# EAGLE design source_eagle (EAGLE 6.2)
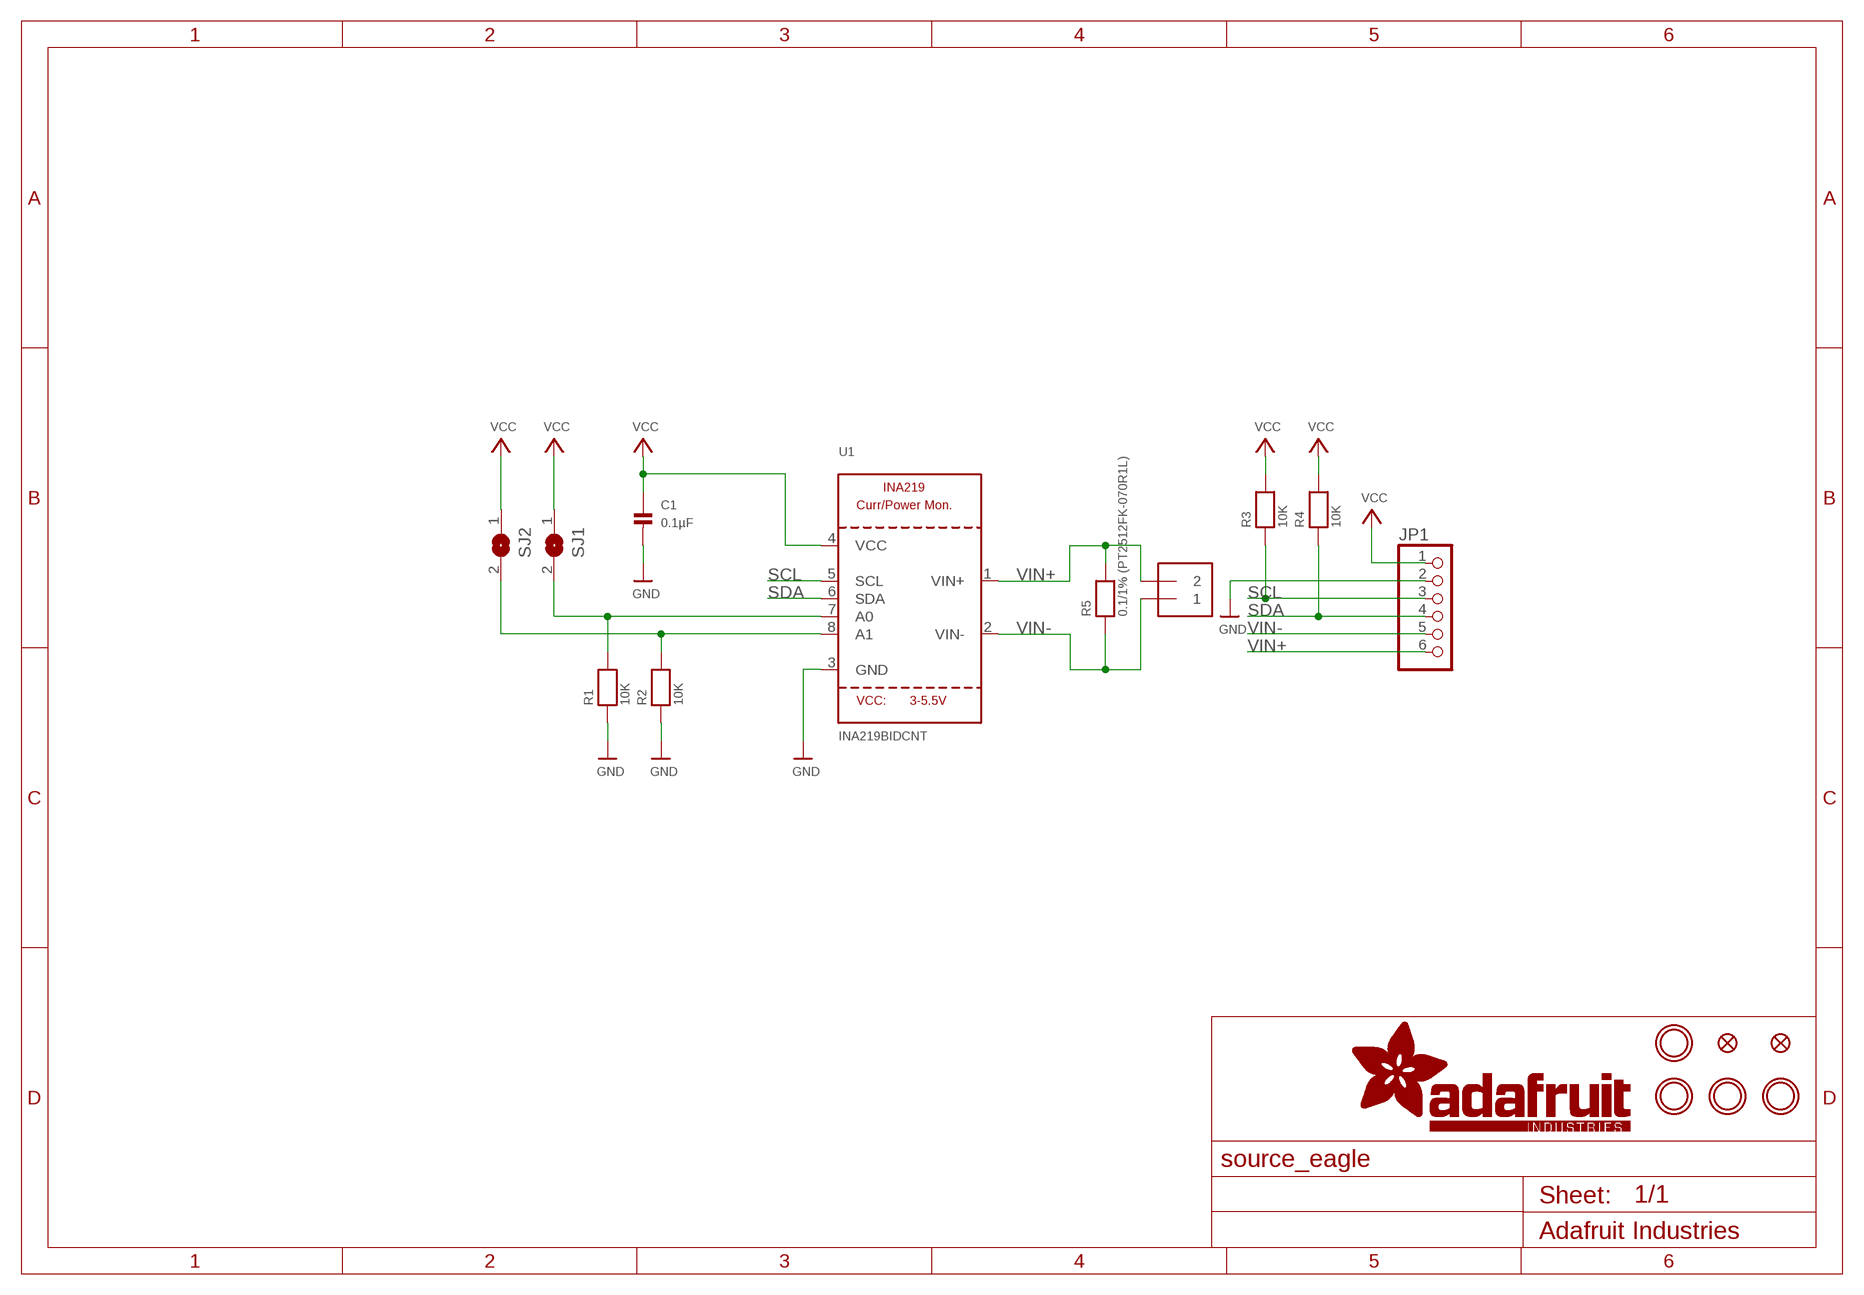
[diagram p0: schematic, sheet 1]

## Parts
C1  0.1µF  CAP_CERAMIC0805  [0805]
FID1  FIDUCIAL""  [FIDUCIAL_1MM]
FID2  FIDUCIAL""  [FIDUCIAL_1MM]
J1  TERMBLOCK_1X2-3.5MM  [1X2-3.5MM]
JP1  HEADER-1X670MIL  [1X06_ROUND_70]
R1  10K  RESISTOR0805  [0805]
R2  10K  RESISTOR0805  [0805]
R3  10K  RESISTOR0805  [0805]
R4  10K  RESISTOR0805  [0805]
R5  0.1/1% (PT2512FK-070R1L)  RESISTOR2512  [2512]
SJ1  SOLDERJUMPERREFLOW_NOPASTE  [SOLDERJUMPER_REFLOW_NOPASTE]
SJ2  SOLDERJUMPERREFLOW_NOPASTE  [SOLDERJUMPER_REFLOW_NOPASTE]
U1  INA219BIDCNT  INA219  [SOT23-8]
U$7  MOUNTINGHOLE2.5  [MOUNTINGHOLE_2.5_PLATED]
U$8  MOUNTINGHOLE2.5  [MOUNTINGHOLE_2.5_PLATED]
U$9  MOUNTINGHOLE2.5  [MOUNTINGHOLE_2.5_PLATED]
U$10  MOUNTINGHOLE2.5  [MOUNTINGHOLE_2.5_PLATED]

## Nets
GND: C1.2 JP1.2 R1.1 R2.1 U1.3(GND)
N$1: R2.2 SJ2.2 U1.8(A1)
N$2: R1.2 SJ1.2 U1.7(A0)
SCL: JP1.3 R3.1 U1.5(SCL)
SDA: JP1.4 R4.1 U1.6(SDA)
VCC: C1.1 JP1.1 R3.2 R4.2 SJ1.1 SJ2.1 U1.4(VCC)
VIN+: J1.2 JP1.6 R5.2 U1.1(VIN+)
VIN-: J1.1 JP1.5 R5.1 U1.2(VIN-)

## Library data of the parts
C1 = microbuilder:CAP_CERAMIC: Ceramic Capacitors 0402 - 0402 Surface Mount Capacitors 16pF 50V 5% [Digikey: 445-4899-2-ND] 18pF 50V 5% [Digikey: 490-1281-2-ND] 22pF 50V 5% [Digikey: 490-1283-2-ND] 68pF 50V 5% [Digikey: 490-1289-2-ND] 0.1uF 10V 10% [Digikey: 490-1318-2-ND] 1.0uF 6.3V 10% [Digikey: 490-1320-2-ND] 0603 - 0603 Surface Mount Capacitors 16 pF 50V 5% [Digikey: 445-5051-2-ND] 22 pF 50V [Digikey: PCC220ACVTR-ND] 33 pF 50V 5% [Digikey: 490-1415-1-ND] 56pF 50V 5% [Digikey: 490-1421-1-ND] 220pF 50V 5% [Digikey: 445-1285-1-ND] 680 pF 50V 2200 pF 50V 5% C0G [Digikey: 445-1297-1-ND] 5600 pF 100V 5% X7R [Digikey: 478-3711-1-ND] 0.1 µF 25V 10% [Digikey: PCC2277TR-ND] 0.22 µF 16V 10% X7R [Digikey: 445-1318-1-ND] 1.0 µF 25V 10% [Digikey: 445-5146-2-ND] 0603 - RF Specific 3pF 250V +/-0.1pF RF [Digikey: 712-1347-1-ND] 18 pF 250V 5% [Digikey: 478-3505-1-ND or 712-1322-1-ND] 56 pF 250V 5% C0G RF [Digikey: 490-4867-1-ND] 68 pF 250V RF [Digikey: 490-4868-1-ND] 0805 - 0805 Surface Mount Capacitors 220 pF 250V 2% RF Ceramic Capacitor [Digikey: 712-1398-1-ND] 1000 pF 50V 2% NP0 Ceramic Capacitor [Digikey: 478-3760-1-ND] 0.1 µF 25V 10% Ceramic Capacitor [Digikey: PCC1828TR-ND] 1.0 µF 16V 10% Ceramic Capacitor[Digikey: 490-1691-2-ND] 10.0 µF 10V 10% Ceramic Capacitor[Digikey: 709-1228-1-ND] 10.0 uF 16V 10% Ceramic Capacitor [Digikey: 478-5165-2-ND] 47 uF 6.3V 20% Ceramic Capacitor [Digikey: 587-1779-1-ND or 399-5506-1-ND] 1206 - 1206 Surface Mount Capacitors 47uF 10V 20% Ceramic Capacitor [Digikey: 490-5528-1-ND or 399-5508-1-ND or 445-6010-1-ND] 100uF 6.3V -20%, +80% Y5V Ceramic Capacitor (Digikey: 490-4512-1-ND, Mouser: 81-GRM31CF50J107ZE1L)
FID1 FID2 = microbuilder:FIDUCIAL: Fiducial Alignment Points Various fiducial points for machine vision alignment.
J1 = microbuilder:TERMBLOCK_1X2: 3.5mm Terminal block http://www.ladyada.net/library/pcb/eaglelibrary.html
JP1 = microbuilder:HEADER-1X6: PIN HEADER
R1-R5 = microbuilder:RESISTOR: Resistors 0402 - 0402 Surface Mount Package 22 Ohm 1% 1/16W [Digikey: 311-22.0LRTR-ND] 33 Ohm 5% 1/16W 1.0K 5% 1/16W 1.5K 5% 1/16W 2.0K 1% 1/16W 10.0K 1% 1/16W [Digikey: 311-10.0KLRTR-ND] 10.0K 5% 1/16W [Digikey: RMCF0402JT10K0TR-ND] 12.1K 1% 1/16W [Digikey: 311-22.0LRTR-ND] 100.0K 5% 1/16W 0603 - 0603 Surface Mount Package 0 Ohm 1/10 Watt 1% Resistor 15 Ohm 1/10 Watt 1% Resistor 33 Ohm 1/10 Watt 1% Resistor 49.9 Ohm 1/10 Watt 1% Resistor 100 Ohm 1/10 Watt 1% Resistor 150 Ohm 1/10 Watt 1% Resistor 240 Ohm 1/10 Watt 1% Resistor 390 Ohm 1/10 Watt 1% Resistor 560 Ohm 1/10 Watt 1% Resistor 680 Ohm 1/10 Watt 1% Resistor 750 Ohm 1/10 Watt 1% Resistor 1.0K Ohm 1/10 Watt 1% Resistor 1.5K Ohm 1/10 Watt 1% Resistor 2.0K Ohm 1/10 Watt 1% Resistor 2.2K Ohm 1/10 Watt 1% Resistor 3.3K Ohm 1/10 Watt 1% Resistor 4.7K Ohm 1/10 Watt 1% Resistor 10.0K Ohm 1/10 Watt 1% Resistor 12.0K Ohm 1/10 Watt 1% Resistor 12.1K Ohm 1/10 Watt 1% Resistor 20.0K Ohm 1/10 Watt 1% Resistor 33.0K Ohm 1/10 Watt 1% Resistor 100.0K Ohm 1/10 Watt 1% Resistor 0805 - 0805 Surface Mount Package 0 Ohm 1/8 Watt 1% Resistor 33 Ohm 1/8 Watt 1% Resistor 100 Ohm 1/8 Watt 1% Resistor 150 Ohm 1/8 Watt 1% Resistor 200 Ohm 1/8 Watt 1% Resistor 240 Ohm 1/8 Watt 1% Resistor 330 Ohm 1/8 Watt 1% Resistor 390 Ohm 1/8 Watt 1% Resistor 470 Ohm 1/8 Watt 1% Resistor 1.0K Ohm 1/8 Watt 1% Resistor 1.5K Ohm 1/8 Watt 1% Resistor 2.0K Ohm 1/8 Watt 1% Resistor 4.7K Ohm 1/8 Watt 1% Resistor 5.1K Ohm 1/8 Watt 1% Resistor 5.6K Ohm 1/8 Watt 1% Resistor 10.0K Ohm 1/8 Watt 1% Resistor 22.0K Ohm 1/8 Watt 1% Resistor 33.0K Ohm 1/8 Watt 1% Resistor 100K Ohm 1/8 Watt 1% Resistor 1206 - 1206 Surface Mount Package 2012 - 2010 Surface Mount Package 0.11 Ohm 1/2 Watt 1% Resistor - Digikey: RHM.11UCT-ND
SJ1 SJ2 = microbuilder:SOLDERJUMPER: SMD Solder JUMPER Solder the two pads together to create a connection, or remove the solder to break it. REFLOW - Use this footprint for solder paste and reflow ovens. WAVE - Use this footprint for hand-soldering (larger pads). CLOSED - Has a trace between the two pads to ensure it is closed by default. The trace needs to be cut to disable the jumper, and can be closed again by creating a solder bridge between the two pads.
U1 = microbuilder:INA219: INA219 - I2C Current/Power Monitor Voltage Range: 0-26V Accuracy: 0.5% Temperature: -40°C - 125°C
U$7-U$10 = microbuilder:MOUNTINGHOLE: Mounting Hole For #2 screws (0.086"/2.18mm width, 0.094"/2.4mm hole) use 2.5mm

## Board
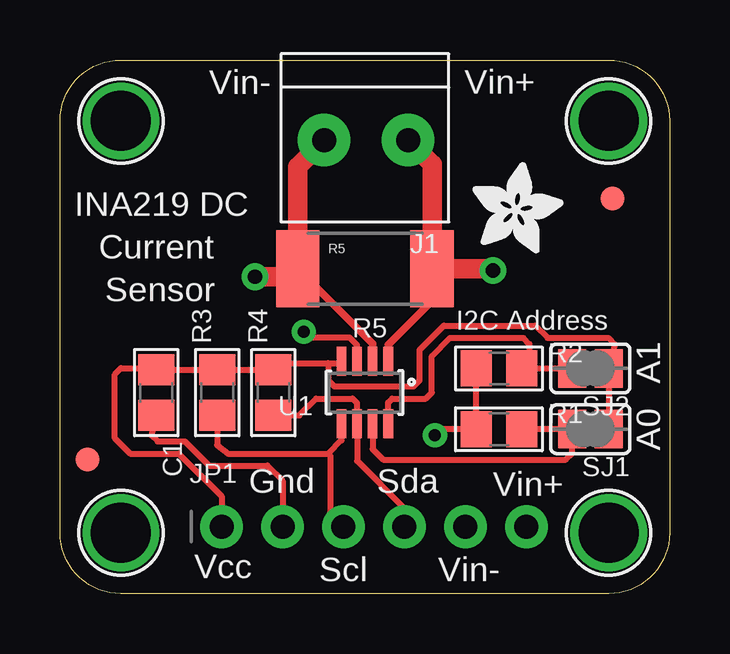
[diagram p1: board, top side]
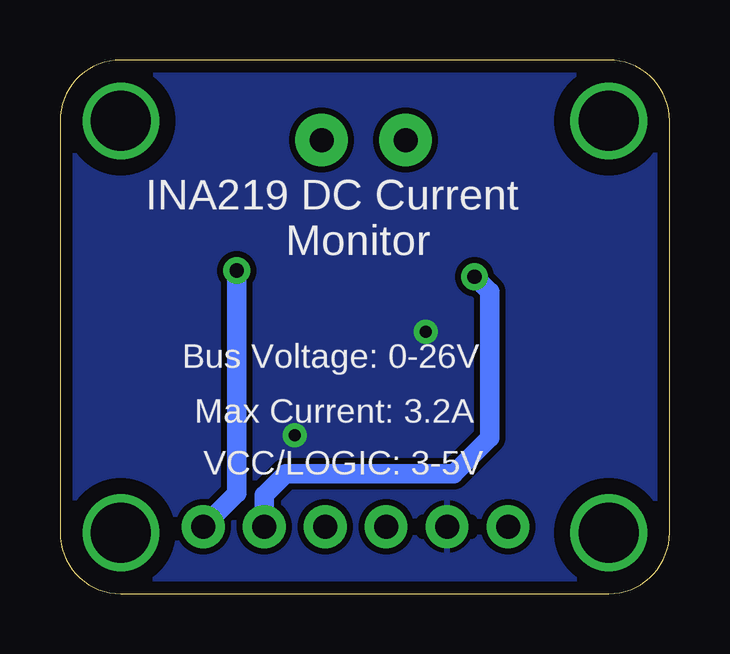
[diagram p2: board, bottom side, seen from below]

Size 25.4 x 22.24 mm. Coordinates in mm from the lower left corner, seen from the top.
Outline: 0,2.54 0,19.7 arc-90 2.54,22.24 22.86,22.24 arc-90 25.4,19.7 25.4,2.54 arc-90 22.86,0 2.54,0 arc-90 0,2.54
Copper layers (1*16): Top 0.035mm / dielectric 1.5mm / Bottom 0.035mm
Design rules: minimum track width 8mil, minimum drill 0.4mm, track to track 8mil, track to pad 8mil, pad to pad 8mil, via to via 8mil, smd to smd 8mil, copper to edge 20mil, drill to drill 8mil, minimum pad ring 8mil, minimum via ring 10mil, stop-mask expansion 3mil, vias tented up to drill 0mil, thermal gap 8mil
bRestrict: area 10.2,2.5 to 10.3,3; area 8.3,2.5 to 8.4,3

### Footprints (pad centres in the part's own frame; a part is rotated, then mirrored left to right if it is on the bottom)
0805 = smd 1.3 x 1.5: 1 -0.95,0; 2 0.95,0
FIDUCIAL_1MM = smd 1 x 1: 1 0,0
1X2-3.5MM = drill 1 pad 2.184: 1 1.8,0; 2 -1.7,0
1X06_ROUND_70 = drill 1 pad 1.778: 1 -6.35,0; 2 -3.81,0; 3 -1.27,0; 4 1.27,0; 5 3.81,0; 6 6.35,0
2512 = smd 1.8 x 3.2: 1 -2.8,0; 2 2.8,0
SOLDERJUMPER_REFLOW_NOPASTE = smd 1.168 x 1.6: 1 -0.762,0; 2 0.762,0
SOT23-8 = smd 0.4 x 1.2: 1 -0.975,-1.3; 2 -0.325,-1.3; 3 0.325,-1.3; 4 0.975,-1.3; 5 0.975,1.3; 6 0.325,1.3; 7 -0.325,1.3; 8 -0.975,1.3
MOUNTINGHOLE_2.5_PLATED = drill 2.5 pad 3.2: P$1 0,0

### Placement (x,y rotation side)
C1  4.01,8.38 270 top
FID1  23.01,16.46 0 top
FID2  1.14,5.59 0 top
J1  12.8,18.9 180 top
JP1  13.08,2.79 0 top
R1  18.29,6.86 0 top
R2  18.29,9.39 0 top
R3  6.55,8.38 90 top
R4  8.89,8.38 90 top
R5  12.7,13.54 0 top
SJ1  22.1,6.86 180 top
SJ2  22.1,9.39 180 top
U1  12.7,8.38 180 top
U$7  22.86,2.54 0 top
U$8  2.54,2.54 0 top
U$9  2.54,19.7 0 top
U$10  22.86,19.7 0 top
U$11  [ADAFRUIT_3.5MM]  17.17,14.18 0 top

### Tracks (layer width: path | path; a pad name or v marks a point on that pad's centre or on a via)
GND  (via drill 0.5)
  Top 0.254: R2.1 R1.1 15.88,6.86 v15.62,6.6 | U1.3 12.38,10.36 12.06,10.67 10.41,10.67 v10.16,10.92 | C1.2 3.81,6.6 4.06,6.35 5.21,6.35 6.22,5.33 8.64,5.33 9.27,4.7 JP1.2 9.14,2.92
  Bottom 0.254: v15.62,6.6 15.62,6.48 | v10.16,10.92 9.91,10.92
  pour Bottom (isolate 0.254): 0,0 0,22.24 26.67,22.24 26.67,0
N$1
  Top 0.254: SJ2.2 R2.2 19.56,9.46 19.56,10.41 19.3,10.66 16.25,10.66 15.49,9.91 15.49,8.38 15.24,8.13 13.84,8.13 13.68,7.96 U1.8
N$2
  Top 0.254: R1.2 SJ1.2 21.34,5.84 21.08,5.59 13.46,5.59 13.03,6.03 U1.7
SCL
  Top 0.254: R3.1 6.55,6.2 7,5.84 11.18,5.84 | 11.18,5.84 11.25,5.77 11.25,3.35 JP1.3 | U1.5 11.72,6.39 11.18,5.84
SDA
  Top 0.254: R4.1 9.97,7.43 10.67,8.13 12.19,8.13 12.38,7.95 U1.6 12.38,5.53 14.35,3.56 JP1.4
VCC
  Top 0.254: SJ1.1 SJ2.1 23.11,10.41 22.86,10.66 20.32,10.66 19.81,11.17 15.99,11.17 14.99,10.16 14.99,8.89 14.73,8.64 11.43,8.64 11.18,8.89 11.18,9.61 | 11.18,9.61 9.17,9.61 R4.2 R3.2 C1.1 3.74,9.4 2.54,9.4 2.29,9.14 2.29,6.48 2.92,5.84 4.95,5.84 6.73,4.06 JP1.1 | 11.18,9.61 11.65,9.61 U1.4
VIN+  (via drill 0.6)
  Top 0.305: U1.1 13.68,10.37 15.49,12.19 R5.2
  Top 0.813: J1.2 15.5,17.9 R5.2 17.95,13.54 v18.03,13.46
  Bottom 0.813: JP1.6 18.03,4.19 v18.03,13.46
VIN-  (via drill 0.6)
  Top 0.305: U1.2 13.03,10.42 R5.1
  Top 0.813: v8.13,13.21 9.57,13.21 R5.1 9.9,17.8 J1.1
  Bottom 0.813: JP1.5 16.89,4.11 16,5 9,5 7.5,6.5 7.5,12.58 v8.13,13.21

### Text on the board
tPlace: Vin- | Vin+ | INA219 DC | Current | Sensor | R5 | I2C Address | A1 | A0 | Gnd | Sda | Vin+ | Vcc | Scl | Vin-
bPlace: INA219 DC Current | Monitor | Bus Voltage: 0-26V | Max Current: 3.2A | VCC/LOGIC: 3-5V